# Altium project GTV3.5_Board.PrjPcb (part 3 of 12)
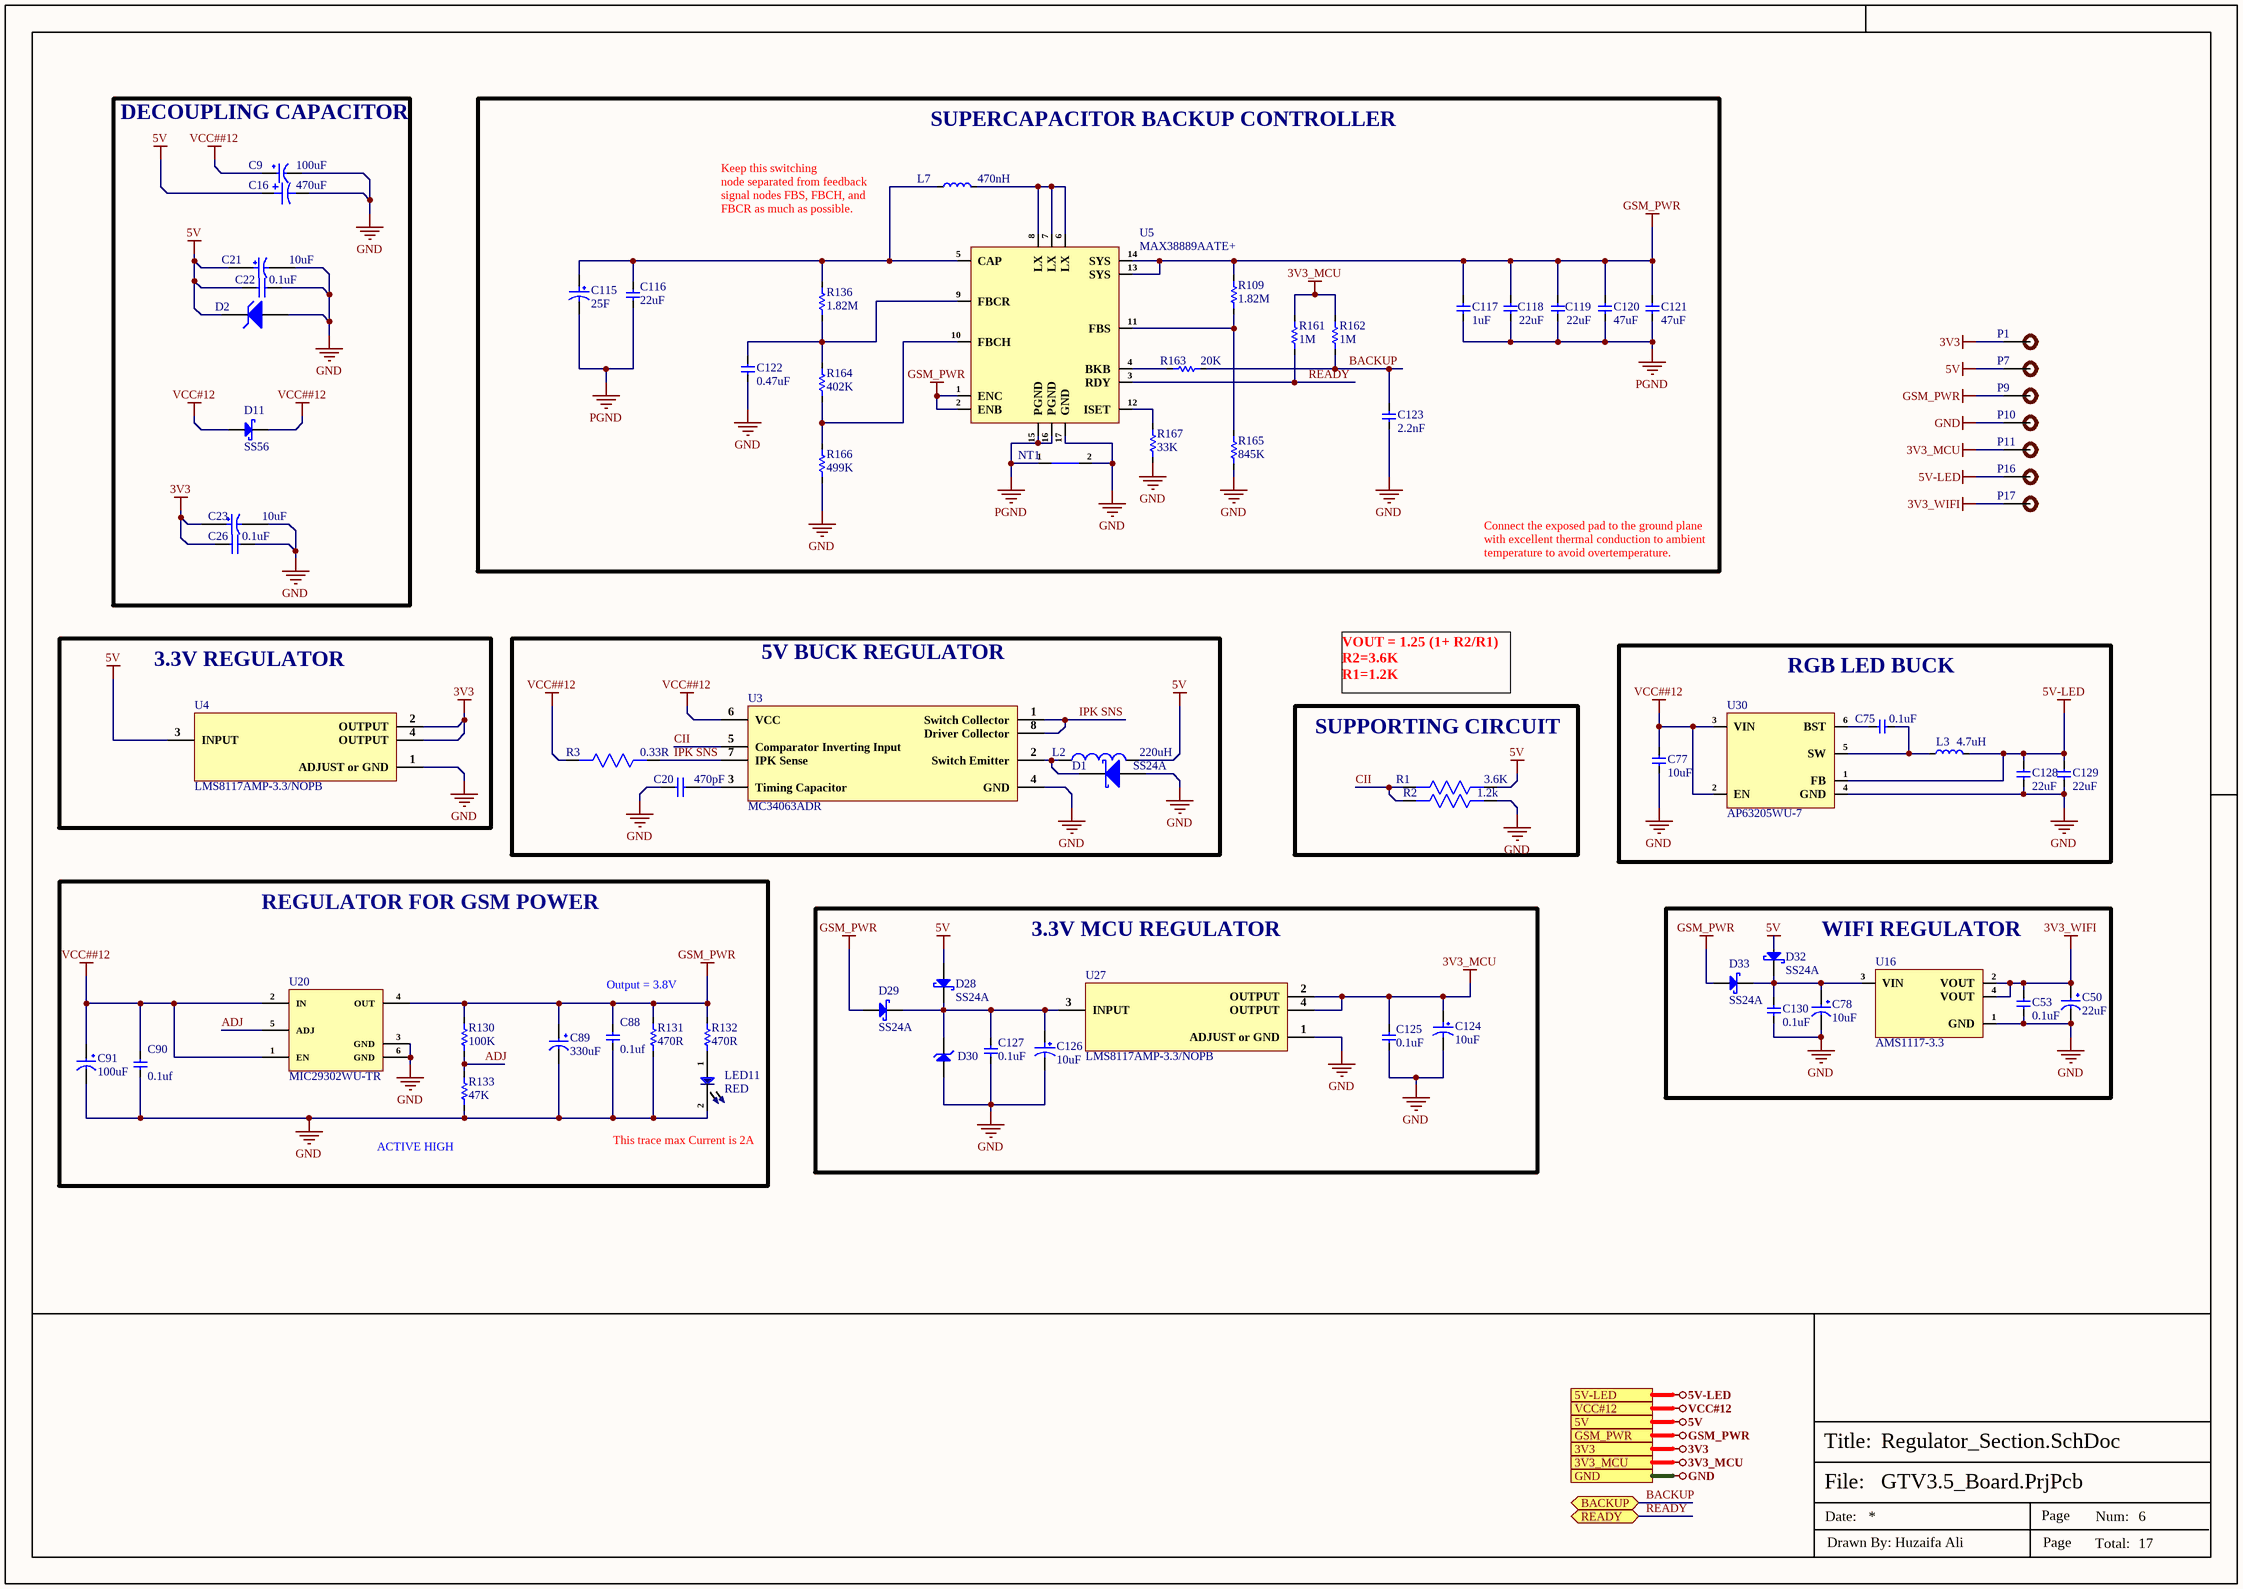
[diagram p109: Regulator_Section.SchDoc]

## Sheet Regulator_Section.SchDoc (continued)

### Library data of the parts (continued)
R130 = RC0201JR-07100KL: RES SMD 100K OHM 5% 1/20W 0201; Manufacturer: Yageo; Resistance: 100kR; Temperature Coefficient: 200ppm/°C; Power Rating: 50mW; Voltage Rating: 25V; Supplier 1: Arrow Electronics; Manufacturer Part Number: RC0201JR-07100KL; RoHS: Yes; Category: Chip SMD Resistors; Stock 1: 76; Pricing 1: 1=0.09240, 10=0.09140, 25=0.05450, 10000=0.00340, 100000=0.00320, 1000000=0.00180, 5000000=0.00110 (USD); Case/Package: 0201; Contact Plating: Tin,Matte; Case Code (Metric): 0603; Case Code (Imperial): 0201; Weight: 6E-06oz; Size Code: 0201; Min Operating Temperature: -55°C; Max Operating Temperature: 125°C; Tolerance: 5%; Resistor Type: Thick Film; Package Quantity: 1; Packaging: Tape and Reel; Number of Terminations: 2; Termination: SMD/SMT; Max Power Dissipation: 50mW; Voltage Rating (DC): 25V; Features: Moisture Resistant; Series: RC; Resistance Tolerance: 5%; Construction: Rectangular; Length: 0.6mm; Width: 0.012inch; Height: 0.01inch; Depth: 0.3mm; Radiation Hardening: No; REACH SVHC: No SVHC; Military Standard: Not; Lead Free: Lead Free; RoHS Compliant: Yes; ComponentLink1URL: https://datasheet.ciiva.com/2462/pyu-r-int-thick-7-2462817.pdf?src-supplier=Digi-Key; ComponentLink1Description: https://datasheet.ciiva.com/2462/pyu-r-int-thick-7-2462817.pdf?src-supplier=Digi-Key; ComponentLink2URL: https://datasheet.ciiva.com/2462/pyu-r-int-thick-7-2462818.pdf?src-supplier=Digi-Key; ComponentLink2Description: https://datasheet.ciiva.com/2462/pyu-r-int-thick-7-2462818.pdf?src-supplier=Digi-Key; ComponentLink3URL: https://datasheet.ciiva.com/2462/pyu-r-int-thick-7-2462819.pdf?src-supplier=Digi-Key; ComponentLink3Description: https://datasheet.ciiva.com/2462/pyu-r-int-thick-7-2462819.pdf?src-supplier=Digi-Key; ComponentLink4URL: https://datasheet.ciiva.com/8888/pyu-rc0201-51-rohs-l-8-8888005.pdf?src-supplier=Avnet; ComponentLink4Description: https://datasheet.ciiva.com/8888/pyu-rc0201-51-rohs-l-8-8888005.pdf?src-supplier=Avnet; ComponentLink5URL: https://datasheet.ciiva.com/8896/pyu-rc0201-51-rohs-l-8-8896213.pdf?src-supplier=Avnet; ComponentLink5Description: https://datasheet.ciiva.com/8896/pyu-rc0201-51-rohs-l-8-8896213.pdf?src-supplier=Avnet; ComponentLink6URL: https://datasheet.ciiva.com/28395/pyu-rc0201-51-rohs-l-8-28395542.pdf?src-supplier=Avnet+Europe; ComponentLink6Description: https://datasheet.ciiva.com/28395/pyu-rc0201-51-rohs-l-8-28395542.pdf?src-supplier=Avnet+Europe; ComponentLink7URL: https://datasheet.ciiva.com/28639/1421516-28639863.pdf?src-supplier=Element14; ComponentLink7Description: https://datasheet.ciiva.com/28639/1421516-28639863.pdf?src-supplier=Element14; ComponentLink8URL: https://datasheet.ciiva.com/7672/1563626-7672249.pdf?src-supplier=Element14; ComponentLink8Description: https://datasheet.ciiva.com/7672/1563626-7672249.pdf?src-supplier=Element14; ComponentLink9URL: https://datasheet.ciiva.com/7672/1563626-7672250.pdf?src-supplier=Element14; ComponentLink9Description: https://datasheet.ciiva.com/7672/1563626-7672250.pdf?src-supplier=Element14; Supplier Part Number 1: RC0201JR-07100KL; LCSC Part Number: C106230
R131 = RC0603FR-07470RL: RES 470 OHM 1% 1/10W 0603; Manufacturer: Yageo; Temperature Coefficient: 100ppm/°C; Max Power Dissipation: 100mW; Voltage Rating: 50V; Working Voltage: 75V; Supplier 1: Digi-Key; Manufacturer Part Number: RC0603FR-07470RL; RoHS: Yes; Category: Chip SMD Resistors; Stock 1: 154083; Pricing 1: 1=0.10000, 10=0.02400, 100=0.00970, 1000=0.00436, 2500=0.00378 (USD); Case/Package: 0603; Case Code (Metric): 1608; Case Code (Imperial): 0603; Min Operating Temperature: -55°C; Max Operating Temperature: 155°C; Resistor Type: Thick Film; Tolerance: 1%; Resistance: 470R; Number of Terminations: 2; Termination: SMD/SMT; Features: Moisture Resistant; Power Rating: 100mW; Package Quantity: 1; Packaging: Tape and Reel; Length: 1.6mm; Width: 0.031inch; Height: 0.022inch; Depth: 0.8mm; Military Standard: Not; Lead Free: Lead Free; REACH SVHC: No SVHC; ComponentLink1URL: https://datasheet.ciiva.com/11808/0900766b80f96399-11808177.pdf?src-supplier=RSComponents; ComponentLink1Description: https://datasheet.ciiva.com/11808/0900766b80f96399-11808177.pdf?src-supplier=RSComponents; ComponentLink2URL: https://datasheet.ciiva.com/7746/1738695-7746359.pdf?src-supplier=Element14; ComponentLink2Description: https://datasheet.ciiva.com/7746/1738695-7746359.pdf?src-supplier=Element14; ComponentLink3URL: https://datasheet.ciiva.com/7746/1738695-7746360.pdf?src-supplier=Element14; ComponentLink3Description: https://datasheet.ciiva.com/7746/1738695-7746360.pdf?src-supplier=Element14; ComponentLink4URL: https://datasheet.ciiva.com/7660/1868787-7660793.pdf?src-supplier=Element14; ComponentLink4Description: https://datasheet.ciiva.com/7660/1868787-7660793.pdf?src-supplier=Element14; ComponentLink5URL: https://datasheet.ciiva.com/46440/1868787-46440907.pdf?src-supplier=Element14; ComponentLink5Description: https://datasheet.ciiva.com/46440/1868787-46440907.pdf?src-supplier=Element14; ComponentLink6URL: https://datasheet.ciiva.com/2454/pyu-r-int-thick-7-2454012.pdf?src-supplier=Digi-Key; ComponentLink6Description: https://datasheet.ciiva.com/2454/pyu-r-int-thick-7-2454012.pdf?src-supplier=Digi-Key; ComponentLink7URL: https://datasheet.ciiva.com/2454/pyu-r-int-thick-7-2454013.pdf?src-supplier=Digi-Key; ComponentLink7Description: https://datasheet.ciiva.com/2454/pyu-r-int-thick-7-2454013.pdf?src-supplier=Digi-Key; Supplier Part Number 1: 311-470HRCT-ND; LCSC Part Number: C114669; Series: RC; Technology: THICK FILM; Resistance Tolerance: 1%; Construction: Rectangular; RoHS Compliant: Yes; ComponentLink8URL: https://datasheet.ciiva.com/2454/pyu-r-int-thick-7-2454014.pdf?src-supplier=Digi-Key; ComponentLink8Description: https://datasheet.ciiva.com/2454/pyu-r-int-thick-7-2454014.pdf?src-supplier=Digi-Key
R132 = RC0201JR-07470RL: RES 470 OHM 5% 1/20W 0201; Manufacturer: Yageo; Temperature Coefficient: 200ppm/°C; Voltage Rating (DC): 25V; Max Power Dissipation: 50mW; Supplier 1: Digi-Key; Manufacturer Part Number: RC0201JR-07470RL; RoHS: Yes; Category: Chip SMD Resistors; Stock 1: 173754; Pricing 1: 1=0.10000, 10=0.02600, 100=0.01040, 1000=0.00466, 2500=0.00405, 5000=0.00334 (USD); Case/Package: 0201; Number of Pins: 2; Contact Plating: Tin,Matte; Case Code (Metric): 0603; Case Code (Imperial): 0201; Min Operating Temperature: -55°C; Max Operating Temperature: 125°C; Resistor Type: Thick Film; Tolerance: 5%; Resistance: 470R; Number of Terminations: 2; Termination: SMD/SMT; Features: Moisture Resistant; Power Rating: 50mW; Voltage Rating: 25V; Package Quantity: 1; Packaging: Tape and Reel; Length: 0.6mm; Width: 0.3mm; Height: 0.01inch; Depth: 0.3mm; Radiation Hardening: No; Military Standard: Not; Lead Free: Lead Free; REACH SVHC: No SVHC; ComponentLink1URL: https://datasheet.ciiva.com/5924/443682-5924928.pdf?src-supplier=Farnell; ComponentLink1Description: https://datasheet.ciiva.com/5924/443682-5924928.pdf?src-supplier=Farnell; ComponentLink2URL: https://datasheet.ciiva.com/8885/pyu-rc0201-51-rohs-l-8-8885600.pdf?src-supplier=Avnet; ComponentLink2Description: https://datasheet.ciiva.com/8885/pyu-rc0201-51-rohs-l-8-8885600.pdf?src-supplier=Avnet; ComponentLink3URL: https://datasheet.ciiva.com/28390/pyu-rc0201-51-rohs-l-8-28390376.pdf?src-supplier=Avnet+Europe; ComponentLink3Description: https://datasheet.ciiva.com/28390/pyu-rc0201-51-rohs-l-8-28390376.pdf?src-supplier=Avnet+Europe; ComponentLink4URL: https://datasheet.ciiva.com/8885/pyu-rc0201-51-rohs-l-8-8885642.pdf?src-supplier=Avnet; ComponentLink4Description: https://datasheet.ciiva.com/8885/pyu-rc0201-51-rohs-l-8-8885642.pdf?src-supplier=Avnet; ComponentLink5URL: https://datasheet.ciiva.com/2462/pyu-r-int-thick-7-2462802.pdf?src-supplier=Digi-Key; ComponentLink5Description: https://datasheet.ciiva.com/2462/pyu-r-int-thick-7-2462802.pdf?src-supplier=Digi-Key; ComponentLink6URL: https://datasheet.ciiva.com/2462/pyu-r-int-thick-7-2462803.pdf?src-supplier=Digi-Key; ComponentLink6Description: https://datasheet.ciiva.com/2462/pyu-r-int-thick-7-2462803.pdf?src-supplier=Digi-Key; ComponentLink7URL: https://datasheet.ciiva.com/2462/pyu-r-int-thick-7-2462804.pdf?src-supplier=Digi-Key; ComponentLink7Description: https://datasheet.ciiva.com/2462/pyu-r-int-thick-7-2462804.pdf?src-supplier=Digi-Key; Supplier Part Number 1: 311-470NCT-ND; LCSC Part Number: C163491
R133 = RC0402FR-0747KL: RES 47K OHM 1% 1/16W 0402; Manufacturer: Yageo; Power Rating: 62.5mW; Temperature Coefficient: 100ppm/°C; Voltage Rating: 50V; Resistance: 47kR; Max Power Dissipation: 63mW; Item Type: Resistor; Supplier 1: Avnet; Manufacturer Part Number: RC0402FR-0747KL; RoHS: Yes; Category: Chip SMD Resistors; Stock 1: 680000; Pricing 1: 10000=0.00085, 20000=0.00087, 40000=0.00084, 60000=0.00083, 80000=0.00079, 100000=0.00078, 1000000=0.00076 (USD); Case/Package: 0402; Case Code (Imperial): 0402; Case Code (Metric): 1005; Size Code: 0402; Min Operating Temperature: -55°C; Max Operating Temperature: 155°C; Tolerance: 1%; Series: RC; Packaging: Tape and Reel; Package Quantity: 1; Termination: SMD/SMT; Resistor Type: Thick Film; Number of Terminations: 2; Features: Moisture Resistant; Resistance Tolerance: 1%; Construction: Rectangular; Length: 1mm; Width: 0.02inch; Height: 0.016inch; Depth: 0.5mm; RoHS Compliant: Yes; Military Standard: Not; Lead Free: Lead Free; ComponentLink1URL: https://datasheet.ciiva.com/46412/1018594-46412839.pdf?src-supplier=Element14; ComponentLink1Description: https://datasheet.ciiva.com/46412/1018594-46412839.pdf?src-supplier=Element14; ComponentLink2URL: https://datasheet.ciiva.com/2453/pyu-r-int-thick-7-2453389.pdf?src-supplier=Digi-Key; ComponentLink2Description: https://datasheet.ciiva.com/2453/pyu-r-int-thick-7-2453389.pdf?src-supplier=Digi-Key; ComponentLink3URL: https://datasheet.ciiva.com/2453/pyu-r-int-thick-7-2453390.pdf?src-supplier=Digi-Key; ComponentLink3Description: https://datasheet.ciiva.com/2453/pyu-r-int-thick-7-2453390.pdf?src-supplier=Digi-Key; ComponentLink4URL: https://datasheet.ciiva.com/2453/pyu-r-int-thick-7-2453388.pdf?src-supplier=Digi-Key; ComponentLink4Description: https://datasheet.ciiva.com/2453/pyu-r-int-thick-7-2453388.pdf?src-supplier=Digi-Key; ComponentLink5URL: https://datasheet.ciiva.com/15189/getdatasheetpartid-323748-15189466.pdf?src-supplier=Verical; ComponentLink5Description: https://datasheet.ciiva.com/15189/getdatasheetpartid-323748-15189466.pdf?src-supplier=Verical; ComponentLink6URL: https://datasheet.ciiva.com/16793/pyu-rc0402-51-rohs-l-6-r-16793430.pdf?src-supplier=Future+Electronics; ComponentLink6Description: https://datasheet.ciiva.com/16793/pyu-rc0402-51-rohs-l-6-r-16793430.pdf?src-supplier=Future+Electronics; Supplier Part Number 1: RC0402FR-0747KL; LCSC Part Number: C93943
R161 R162 = RC0603FR-071ML: RES SMD 1M OHM 1% 1/10W 0603; Manufacturer: Yageo; Voltage Rating: 50V; Resistance: 1MR; Power Rating: 100mW; Temperature Coefficient: 100ppm/°C; Item Type: Resistor; Supplier 1: Digi-Key; Manufacturer Part Number: RC0603FR-071ML; Stock 1: 3824601; Pricing 1: 1=0.1, 10=0.023, 100=0.0094, 1000=0.00421, 2500=0.00366 (USD); Case/Package: 0603; Number of Pins: 2; Case Code (Imperial): 0603; Case Code (Metric): 1608; Min Operating Temperature: -55°C; Max Operating Temperature: 155°C; Voltage Rating (DC): 50V; Tolerance: 1%; Packaging: Tape and Reel; Package Quantity: 5000; Termination: SMD/SMT; Composition: Thick Film; Military Standard: Not; Length: 1.6mm; Height: 0.45mm; Width: 0.8mm; Depth: 0.8mm; REACH SVHC: No SVHC; Lead Free: Lead Free; ComponentLink1URL: http://www.farnell.com/datasheets/2167052.pdf?src-supplier=Mouser; ComponentLink1Description: http://www.farnell.com/datasheets/2167052.pdf?src-supplier=Mouser; ComponentLink2URL: http://www.farnell.com/datasheets/2167052.pdf?src-supplier=Element14; ComponentLink2Description: http://www.farnell.com/datasheets/2167052.pdf?src-supplier=Element14; ComponentLink3URL: http://documents.rs-components.com/techlib://itc_doclist_GB.htm?stockno=5048956&src-supplier=RSComponents; ComponentLink3Description: http://documents.rs-components.com/techlib://itc_doclist_GB.htm?stockno=5048956&src-supplier=RSComponents; Supplier Part Number 1: 311-1.00MHRDKR-ND; LCSC Part Number: C105578
R163 = RC0603FR-0720KL: RES 20K OHM 1% 1/10W 0603; Manufacturer: Yageo; Resistance: 20kR; Temperature Coefficient: 100ppm/°C; Voltage Rating (DC): 50V; Power Rating: 100mW; Item Type: Resistor; Supplier 1: Arrow Electronics; Manufacturer Part Number: RC0603FR-0720KL; RoHS: Yes; Category: Chip SMD Resistors; Stock 1: 945000; Pricing 1: 5000=0.00240, 10000=0.00220, 25000=0.00200, 50000=0.00190, 125000=0.00180 (USD); Case/Package: 0603; Number of Pins: 2; Case Code (Imperial): 0603; Case Code (Metric): 1608; Size Code: 0603; Min Operating Temperature: -55°C; Max Operating Temperature: 155°C; Tolerance: 1%; Packaging: Tape and Reel; Resistor Type: Thick Film; Voltage Rating: 50V; Package Quantity: 1; Termination: SMD/SMT; Number of Terminations: 2; Max Power Dissipation: 100mW; Features: Moisture Resistant; Series: RC; Technology: THICK FILM; Construction: Rectangular; Resistance Tolerance: 1%; Length: 0.063inch; Width: 0.031inch; Height: 0.022inch; Depth: 0.8mm; Lead Free: Lead Free; RoHS Compliant: Yes; REACH SVHC: No SVHC; Military Standard: Not; ComponentLink1URL: https://datasheet.ciiva.com/11808/0900766b80f96399-11808275.pdf?src-supplier=RSComponents; ComponentLink1Description: https://datasheet.ciiva.com/11808/0900766b80f96399-11808275.pdf?src-supplier=RSComponents; ComponentLink2URL: https://datasheet.ciiva.com/22747/443971-22747525.pdf?src-supplier=Element14; ComponentLink2Description: https://datasheet.ciiva.com/22747/443971-22747525.pdf?src-supplier=Element14; ComponentLink3URL: https://datasheet.ciiva.com/2453/pyu-r-int-thick-7-2453911.pdf?src-supplier=Digi-Key; ComponentLink3Description: https://datasheet.ciiva.com/2453/pyu-r-int-thick-7-2453911.pdf?src-supplier=Digi-Key; ComponentLink4URL: https://datasheet.ciiva.com/2453/pyu-r-int-thick-7-2453912.pdf?src-supplier=Digi-Key; ComponentLink4Description: https://datasheet.ciiva.com/2453/pyu-r-int-thick-7-2453912.pdf?src-supplier=Digi-Key; ComponentLink5URL: https://datasheet.ciiva.com/2453/pyu-r-int-thick-7-2453910.pdf?src-supplier=Digi-Key; ComponentLink5Description: https://datasheet.ciiva.com/2453/pyu-r-int-thick-7-2453910.pdf?src-supplier=Digi-Key; Supplier Part Number 1: RC0603FR-0720KL; LCSC Part Number: C105575
R164 = CRCW0603402KFKEA: RES SMD 402K OHM 1% 1/10W 0603; Manufacturer: Vishay; Voltage Rating (DC): 75V; Item Type: Resistor; Supplier: Mouser; Supplier Part Number: 71-CRCW0603-402K-E3; Manufacturer Part Number: CRCW0603402KFKEA; RoHS: Yes; Category: Chip SMD Resistors; Stock: 15471; Pricing: 1=0.1, 10=0.019, 50=0.019, 100=0.009, 1000=0.007, 10000=0.004 (USD); Lead Free: 5697LeadFree; ComponentLink1URL: https://datasheet.ciiva.com/5541/dcrcwe3-109170-5541596.pdf?src-supplier=Mouser; ComponentLink1Description: https://datasheet.ciiva.com/5541/dcrcwe3-109170-5541596.pdf?src-supplier=Mouser; ComponentLink2URL: https://datasheet.ciiva.com/22705/1697337-22705964.pdf?src-supplier=Element14; ComponentLink2Description: https://datasheet.ciiva.com/22705/1697337-22705964.pdf?src-supplier=Element14; ComponentLink3URL: https://datasheet.ciiva.com/7792/125364-7792268.pdf?src-supplier=Element14; ComponentLink3Description: https://datasheet.ciiva.com/7792/125364-7792268.pdf?src-supplier=Element14; ComponentLink4URL: https://datasheet.ciiva.com/7674/1697337-7674093.pdf?src-supplier=Element14; ComponentLink4Description: https://datasheet.ciiva.com/7674/1697337-7674093.pdf?src-supplier=Element14; ComponentLink5URL: https://datasheet.ciiva.com/7674/1697337-7674094.pdf?src-supplier=Element14; ComponentLink5Description: https://datasheet.ciiva.com/7674/1697337-7674094.pdf?src-supplier=Element14; ComponentLink6URL: https://datasheet.ciiva.com/3257/dcrcwe3-3257561.pdf?src-supplier=Avnet; ComponentLink6Description: https://datasheet.ciiva.com/3257/dcrcwe3-3257561.pdf?src-supplier=Avnet; ComponentLink7URL: https://datasheet.ciiva.com/2466/dcrcwe3-2466643.pdf?src-supplier=Digikey; ComponentLink7Description: https://datasheet.ciiva.com/2466/dcrcwe3-2466643.pdf?src-supplier=Digikey; ComponentLink8URL: https://datasheet.ciiva.com/2466/dcrcwe3-2466641.pdf?src-supplier=Digikey; ComponentLink8Description: https://datasheet.ciiva.com/2466/dcrcwe3-2466641.pdf?src-supplier=Digikey; ComponentLink9URL: https://datasheet.ciiva.com/2466/dcrcwe3-2466642.pdf?src-supplier=Digikey; ComponentLink9Description: https://datasheet.ciiva.com/2466/dcrcwe3-2466642.pdf?src-supplier=Digikey; ComponentLink10URL: https://datasheet.ciiva.com/16769/70201119-16769689.pdf?src-supplier=Allied+Electronics; ComponentLink10Description: https://datasheet.ciiva.com/16769/70201119-16769689.pdf?src-supplier=Allied+Electronics; ComponentLink11URL: https://datasheet.ciiva.com/16427/dcrcwe3-16427337.pdf?src-supplier=Future+Electronics; ComponentLink11Description: https://datasheet.ciiva.com/16427/dcrcwe3-16427337.pdf?src-supplier=Future+Electronics
R165 = RC0603FR-07845KL: RES 845K OHM 1% 1/10W 0603; Manufacturer: Yageo; Item Type: Resistor; Supplier: Future Electronics; Supplier Part Number: 2538940; Manufacturer Part Number: RC0603FR-07845KL; RoHS: Yes; Category: Chip SMD Resistors; Stock: 90000; Pricing: 5000=0.0026, 50000=0.0025, 150000=0.0024, 375000=0.0023, 1000000=0.0021 (USD); ComponentLink1URL: https://datasheet.ciiva.com/8884/pyu-rc0603-51-rohs-l-4-8884697.pdf?src-supplier=Avnet; ComponentLink1Description: https://datasheet.ciiva.com/8884/pyu-rc0603-51-rohs-l-4-8884697.pdf?src-supplier=Avnet; ComponentLink2URL: https://datasheet.ciiva.com/2455/pyu-r-int-thick-7-2455278.pdf?src-supplier=Digikey; ComponentLink2Description: https://datasheet.ciiva.com/2455/pyu-r-int-thick-7-2455278.pdf?src-supplier=Digikey; ComponentLink3URL: https://datasheet.ciiva.com/2455/pyu-r-int-thick-7-2455279.pdf?src-supplier=Digikey; ComponentLink3Description: https://datasheet.ciiva.com/2455/pyu-r-int-thick-7-2455279.pdf?src-supplier=Digikey; ComponentLink4URL: https://datasheet.ciiva.com/2455/pyu-r-int-thick-7-2455280.pdf?src-supplier=Digikey; ComponentLink4Description: https://datasheet.ciiva.com/2455/pyu-r-int-thick-7-2455280.pdf?src-supplier=Digikey
R166 = RC0603FR-07499KL: RES 499K OHM 1% 1/10W 0603; Manufacturer: Yageo; Voltage Rating (DC): 50V; Item Type: Resistor; Supplier: Future Electronics; Supplier Part Number: 1580604; Manufacturer Part Number: RC0603FR-07499KL; RoHS: Yes; Category: Chip SMD Resistors; Stock: 750000; Pricing: 5000=0.0015, 50000=0.0014, 200000=0.0014, 625000=0.0013, 2000000=0.0012 (USD); Lead Free: 5697LeadFree; ComponentLink1URL: https://datasheet.ciiva.com/15189/getdatasheetpartid-329306-15189746.pdf?src-supplier=Verical; ComponentLink1Description: https://datasheet.ciiva.com/15189/getdatasheetpartid-329306-15189746.pdf?src-supplier=Verical; ComponentLink2URL: https://datasheet.ciiva.com/11819/0900766b80f96399-11819364.pdf?src-supplier=Rs; ComponentLink2Description: https://datasheet.ciiva.com/11819/0900766b80f96399-11819364.pdf?src-supplier=Rs; ComponentLink3URL: https://datasheet.ciiva.com/2454/pyu-r-int-thick-7-2454186.pdf?src-supplier=Digi-Key; ComponentLink3Description: https://datasheet.ciiva.com/2454/pyu-r-int-thick-7-2454186.pdf?src-supplier=Digi-Key; ComponentLink4URL: https://datasheet.ciiva.com/2454/pyu-r-int-thick-7-2454187.pdf?src-supplier=Digi-Key; ComponentLink4Description: https://datasheet.ciiva.com/2454/pyu-r-int-thick-7-2454187.pdf?src-supplier=Digi-Key; ComponentLink5URL: https://datasheet.ciiva.com/2454/pyu-r-int-thick-7-2454188.pdf?src-supplier=Digi-Key; ComponentLink5Description: https://datasheet.ciiva.com/2454/pyu-r-int-thick-7-2454188.pdf?src-supplier=Digi-Key; LCSC Part Number: C131054
R167 = CRCW060333K0JNEA: RES SMD 33K OHM 5% 1/10W 0603; Item Type: Resistor; Value: 33kR; Power Rating: 100mW; Voltage Rating: 75V; Temperature Coefficient: 200ppm/°C; LCSC Part Number: C4342762; ComponentLink1Description: LCSC; Supplier: Mouser; Supplier Part Number: 71-CRCW0603J-33K-E3; RoHS: Yes; Category: Chip SMD Resistors; Stock: 42690; Pricing: 1=0.1, 10=0.017, 50=0.017, 100=0.008, 1000=0.006, 10000=0.003 (USD); Case/Package: 0603; Pins: 2; Case Code (Metric): 1608; Case Code (Imperial): 0603; Weight: 7.1E-05oz; Contact Plating: Tin; Min Operating Temperature: -55°C; Max Operating Temperature: 155°C; Tolerance: 5%; Packaging: Tape and Reel; Package Quantity: 5000; Resistor Type: Thick Film; Number of Terminations: 2; Termination: SMD/SMT; Max Power Dissipation: 100mW; Voltage Rating (DC): 75V; Features: Automotive AEC-Q200; Series: CRCW; Resistance Tolerance: 5%; Construction: Rectangular; Technology: THICK FILM; Length: 1.55mm; Width: 0.85mm; Height: 0.45mm; Depth: 0.85mm; Ratings: AEC-Q200; Radiation Hardening: No; Lead Free: Lead Free; RoHS Compliant: Yes; Reach SVHC Compliant: Unknown; Military Standard: Not; ComponentLink2URL: https://datasheet.ciiva.com/2462/dcrcwe3-2462530.pdf?src-supplier=Digi-Key; ComponentLink2Description: https://datasheet.ciiva.com/2462/dcrcwe3-2462530.pdf?src-supplier=Digi-Key; ComponentLink3URL: https://datasheet.ciiva.com/2462/dcrcwe3-2462531.pdf?src-supplier=Digi-Key; ComponentLink3Description: https://datasheet.ciiva.com/2462/dcrcwe3-2462531.pdf?src-supplier=Digi-Key; ComponentLink4URL: https://datasheet.ciiva.com/2462/dcrcwe3-2462529.pdf?src-supplier=Digi-Key; ComponentLink4Description: https://datasheet.ciiva.com/2462/dcrcwe3-2462529.pdf?src-supplier=Digi-Key; ComponentLink5URL: https://datasheet.ciiva.com/16778/70201119-16778952.pdf?src-supplier=Allied+Electronics; ComponentLink5Description: https://datasheet.ciiva.com/16778/70201119-16778952.pdf?src-supplier=Allied+Electronics; ComponentLink6URL: https://datasheet.ciiva.com/5551/dcrcwe3-109170-5551035.pdf?src-supplier=Mouser; ComponentLink6Description: https://datasheet.ciiva.com/5551/dcrcwe3-109170-5551035.pdf?src-supplier=Mouser; ComponentLink7URL: https://datasheet.ciiva.com/3257/dcrcwe3-3257470.pdf?src-supplier=Avnet; ComponentLink7Description: https://datasheet.ciiva.com/3257/dcrcwe3-3257470.pdf?src-supplier=Avnet; ComponentLink8URL: https://datasheet.ciiva.com/16389/dcrcwe3-16389979.pdf?src-supplier=Future+Electronics; ComponentLink8Description: https://datasheet.ciiva.com/16389/dcrcwe3-16389979.pdf?src-supplier=Future+Electronics; ComponentLink9URL: https://datasheet.ciiva.com/3257/dcrcwe3-3257469.pdf?src-supplier=Avnet; ComponentLink9Description: https://datasheet.ciiva.com/3257/dcrcwe3-3257469.pdf?src-supplier=Avnet
U3 = MC34063ADR: 1.5-A boost, buck, inverting switching regulator, operation from 0°C to 70°C 8-SOIC 0 to 70; Manufacturer: Texas Instruments; Output Voltage: 40V; Number of Outputs: 1; Output Current: 1.5A; Switching Frequency: 100kHz; Synchronous Rectifier: No; Output Type: Adjustable; Max Output Current: 750mA; Min Input Voltage: 3V; Min Output Voltage: 1.55V; Quiescent Current: 4mA; Topology: Flyback,SEPIC; Supplier 1: Digi-Key; Manufacturer Part Number: MC34063ADR; RoHS: Yes; Category: Power Supply Modules; Stock 1: 17204; Pricing 1: 1=0.78000, 10=0.68400, 25=0.64240, 100=0.52420, 250=0.48688, 500=0.41438, 1000=0.34206 (USD); Case/Package: D; Number of Pins: 8; Weight: 0.002561oz; Contact Plating: Gold; Min Operating Temperature: 0°C; Max Operating Temperature: 70°C; Packaging: Tape and Reel; Package Quantity: 1; Max Input Voltage: 40V; Max Output Voltage: 40V; Termination: SMD/SMT; Radiation Hardening: No; RoHS Compliant: Yes; Lead Free: Lead Free; REACH SVHC: No SVHC; ComponentLink1URL: https://datasheet.ciiva.com/7408/1862376-7408060.pdf?src-supplier=Newark; ComponentLink1Description: https://datasheet.ciiva.com/7408/1862376-7408060.pdf?src-supplier=Newark; ComponentLink2URL: https://datasheet.ciiva.com/2025/mc33063a-2025162.pdf?src-supplier=Digi-Key; ComponentLink2Description: https://datasheet.ciiva.com/2025/mc33063a-2025162.pdf?src-supplier=Digi-Key; ComponentLink3URL: https://datasheet.ciiva.com/2025/mc33063a-2025161.pdf?src-supplier=Digi-Key; ComponentLink3Description: https://datasheet.ciiva.com/2025/mc33063a-2025161.pdf?src-supplier=Digi-Key; ComponentLink4URL: https://datasheet.ciiva.com/2025/mc33063a-2025163.pdf?src-supplier=Digi-Key; ComponentLink4Description: https://datasheet.ciiva.com/2025/mc33063a-2025163.pdf?src-supplier=Digi-Key; Supplier Part Number 1: 296-17765-1-ND
U4 U27 = LMS8117AMP-3.3/NOPB: IC REG LINEAR 3.3V 1A SOT223; Manufacturer: Texas Instruments; Number of Outputs: 1; Min Input Voltage: 2.5V; Max Input Voltage: 15V; Polarity: Positive; Quiescent Current: 10mA; Accuracy: 1%; Output Type: Fixed; Dropout Voltage: 1.2V; Nominal Supply Current: 5mA; Supplier 1: Arrow Electronics; Manufacturer Part Number: LMS8117AMP-3.3/NOPB; RoHS: Yes; Category: Voltage Regulators - Linear; Stock 1: 843; Pricing 1: 1=1.18760, 10=1.01800, 100=0.77540, 250=0.68460, 500=0.64870, 1000=0.59270 (USD); Mount: Surface Mount; Case/Package: SOT-223; Number of Pins: 4; Contact Plating: Tin,Matte; Min Operating Temperature: 0°C; Max Operating Temperature: 125°C; Output Voltage: 3.3V; Max Output Current: 1A; Packaging: Tape and Reel; Output Current: 1A; Nominal Output Voltage: 3.3V; Output Voltage Accuracy: 1%; Current Rating: 1A; Package Quantity: 1000; Length: 6.5mm; Width: 3.56mm; Height: 1.6mm; Radiation Hardening: No; REACH SVHC: No SVHC; Lead Free: Lead Free; RoHS Compliant: Yes; Supplier Part Number 1: LMS8117AMP-3.3/NOPB
  U4: ComponentLink1URL: https://datasheet.ciiva.com/3225/lms8117a-3225472.pdf?src-supplier=Avnet; ComponentLink1Description: https://datasheet.ciiva.com/3225/lms8117a-3225472.pdf?src-supplier=Avnet; ComponentLink2URL: https://datasheet.ciiva.com/2066/lms8117a-2066594.pdf?src-supplier=Digi-Key; ComponentLink2Description: https://datasheet.ciiva.com/2066/lms8117a-2066594.pdf?src-supplier=Digi-Key; ComponentLink3URL: https://datasheet.ciiva.com/2066/lms8117a-2066595.pdf?src-supplier=Digi-Key; ComponentLink3Description: https://datasheet.ciiva.com/2066/lms8117a-2066595.pdf?src-supplier=Digi-Key; ComponentLink4URL: https://datasheet.ciiva.com/2066/lms8117a-2066596.pdf?src-supplier=Digi-Key; ComponentLink4Description: https://datasheet.ciiva.com/2066/lms8117a-2066596.pdf?src-supplier=Digi-Key; ComponentLink5URL: https://datasheet.ciiva.com/3223/lms8117a-3223813.pdf?src-supplier=Avnet; ComponentLink5Description: https://datasheet.ciiva.com/3223/lms8117a-3223813.pdf?src-supplier=Avnet; ComponentLink6URL: https://datasheet.ciiva.com/25979/lms8117a-25979141.pdf?src-supplier=Avnet+Europe; ComponentLink6Description: https://datasheet.ciiva.com/25979/lms8117a-25979141.pdf?src-supplier=Avnet+Europe; ComponentLink7URL: https://datasheet.ciiva.com/46386/1558097-46386039.pdf?src-supplier=Element14; ComponentLink7Description: https://datasheet.ciiva.com/46386/1558097-46386039.pdf?src-supplier=Element14; ComponentLink8URL: https://datasheet.ciiva.com/8042/90386-8042363.pdf?src-supplier=Element14; ComponentLink8Description: https://datasheet.ciiva.com/8042/90386-8042363.pdf?src-supplier=Element14; ComponentLink9URL: https://datasheet.ciiva.com/5697/1558097-5697692.pdf?src-supplier=Farnell; ComponentLink9Description: https://datasheet.ciiva.com/5697/1558097-5697692.pdf?src-supplier=Farnell
  U27: LCSC Part Number: C201952; Item Type: IC; ComponentLink11Description: LCSC; ComponentLink11URL: https://www.lcsc.com/product-detail/Linear-Voltage-Regulators-LDO_Texas-Instruments-LMS8117AMP-3-3-NOPB_C201952.html
U5 = MAX38889AATE+: IC REG BUCK-BOOST ADJ 3A 16TQFN; Manufacturer: Analog Devices; Supplier: Mouser; Supplier Part Number: 700-MAX38889AATE+; Manufacturer Part Number: MAX38889AATE+; RoHS: No; Category: Voltage Regulators - Switching; Stock: 2896; Pricing: 1=6.25, 10=5.65, 50=4.68, 100=4.47, 1000=3.7, 10000=3.7 (USD); Item Type: IC
U16 = AMS1117-3.3: SOT-223 Linear Voltage Regulators (LDO) ROHS; Manufacturer: GUOXIN JIAPIN SEMICONDUCTOR; Item Type: IC; Manufacturer Part Number: AMS1117-3.3; Package: SOT-223; LCSC Part Number: C2992570; ComponentLink1Description: LCSC; ComponentLink1URL: https://www.lcsc.com/product-detail/Linear-Voltage-Regulators-LDO_GUOXIN-JIAPIN-SEMICONDUCTOR-AMS1117-3-3_C2992570.html
U20 = MIC29302WU-TR: IC REG LDO ADJ 3A TO263-5; Manufacturer: Microchip; Output Voltage: 26V; Dropout Voltage: 370mV; Number of Regulators: 1; Min Input Voltage: 2.5V; Min Output Voltage: 1.25V; Max Output Voltage: 25V; Output Type: Adjustable; Output Configuration: Positive; Input Bias Current: 40nA; Reference Voltage: 1.24V; Quiescent Current: 35mA; Accuracy: 1%; Supplier 1: Future Electronics; Manufacturer Part Number: MIC29302WU-TR; RoHS: Yes; Category: Voltage Regulators - Linear; Pricing 1: 750=2.12000, 1500=2.09000, 2250=2.07000, 3000=2.06000, 3750=2.02000 (USD); Mount: Surface Mount; Case/Package: TO-263; Number of Pins: 5; Min Operating Temperature: -40°C; Max Operating Temperature: 125°C; Packaging: Tape and Reel; Package Quantity: 750; Series: -; Output Current: 3A; Max Input Voltage: 26V; Polarity: Positive; Number of Outputs: 1; Max Output Current: 3A; Length: 10.67mm; Width: 9.17mm; Height: 4.59mm; Radiation Hardening: No; Reach SVHC Compliant: Yes; RoHS Compliant: Yes; Lead Free: Lead Free; ComponentLink1URL: https://datasheet.ciiva.com/23772/1572633-23772885.pdf?src-supplier=Newark; ComponentLink1Description: https://datasheet.ciiva.com/23772/1572633-23772885.pdf?src-supplier=Newark; ComponentLink2URL: https://datasheet.ciiva.com/16296/mic29150-16296190.pdf?src-supplier=Future+Electronics; ComponentLink2Description: https://datasheet.ciiva.com/16296/mic29150-16296190.pdf?src-supplier=Future+Electronics; ComponentLink3URL: https://datasheet.ciiva.com/15200/getdatasheetpartid-143209-15200663.pdf?src-supplier=Verical; ComponentLink3Description: https://datasheet.ciiva.com/15200/getdatasheetpartid-143209-15200663.pdf?src-supplier=Verical; Supplier Part Number 1: 3153683; LCSC Part Number: C11149; Item Type: IC
U30 = AP63205WU-7: IC REG BUCK 5V 2A TSOT26; Manufacturer: Diodes; Supplier 1: Digi-Key; Manufacturer Part Number: AP63205WU-7; RoHS: Yes; Category: Voltage Regulators - Switching; Stock 1: 88525; Pricing 1: 1=0.88, 10=0.776, 25=0.7292, 100=0.5952, 250=0.55284, 500=0.4705, 1000=0.3764 (USD); Supplier Part Number 1: AP63205WU-7DICT-ND; LCSC Part Number: C2071056; Item Type: IC

## Sheet Reverse Protection_Section.SchDoc
size 420 x 297 mm; DocumentNumber: 3; SheetNumber: 3; SheetTotal: 17
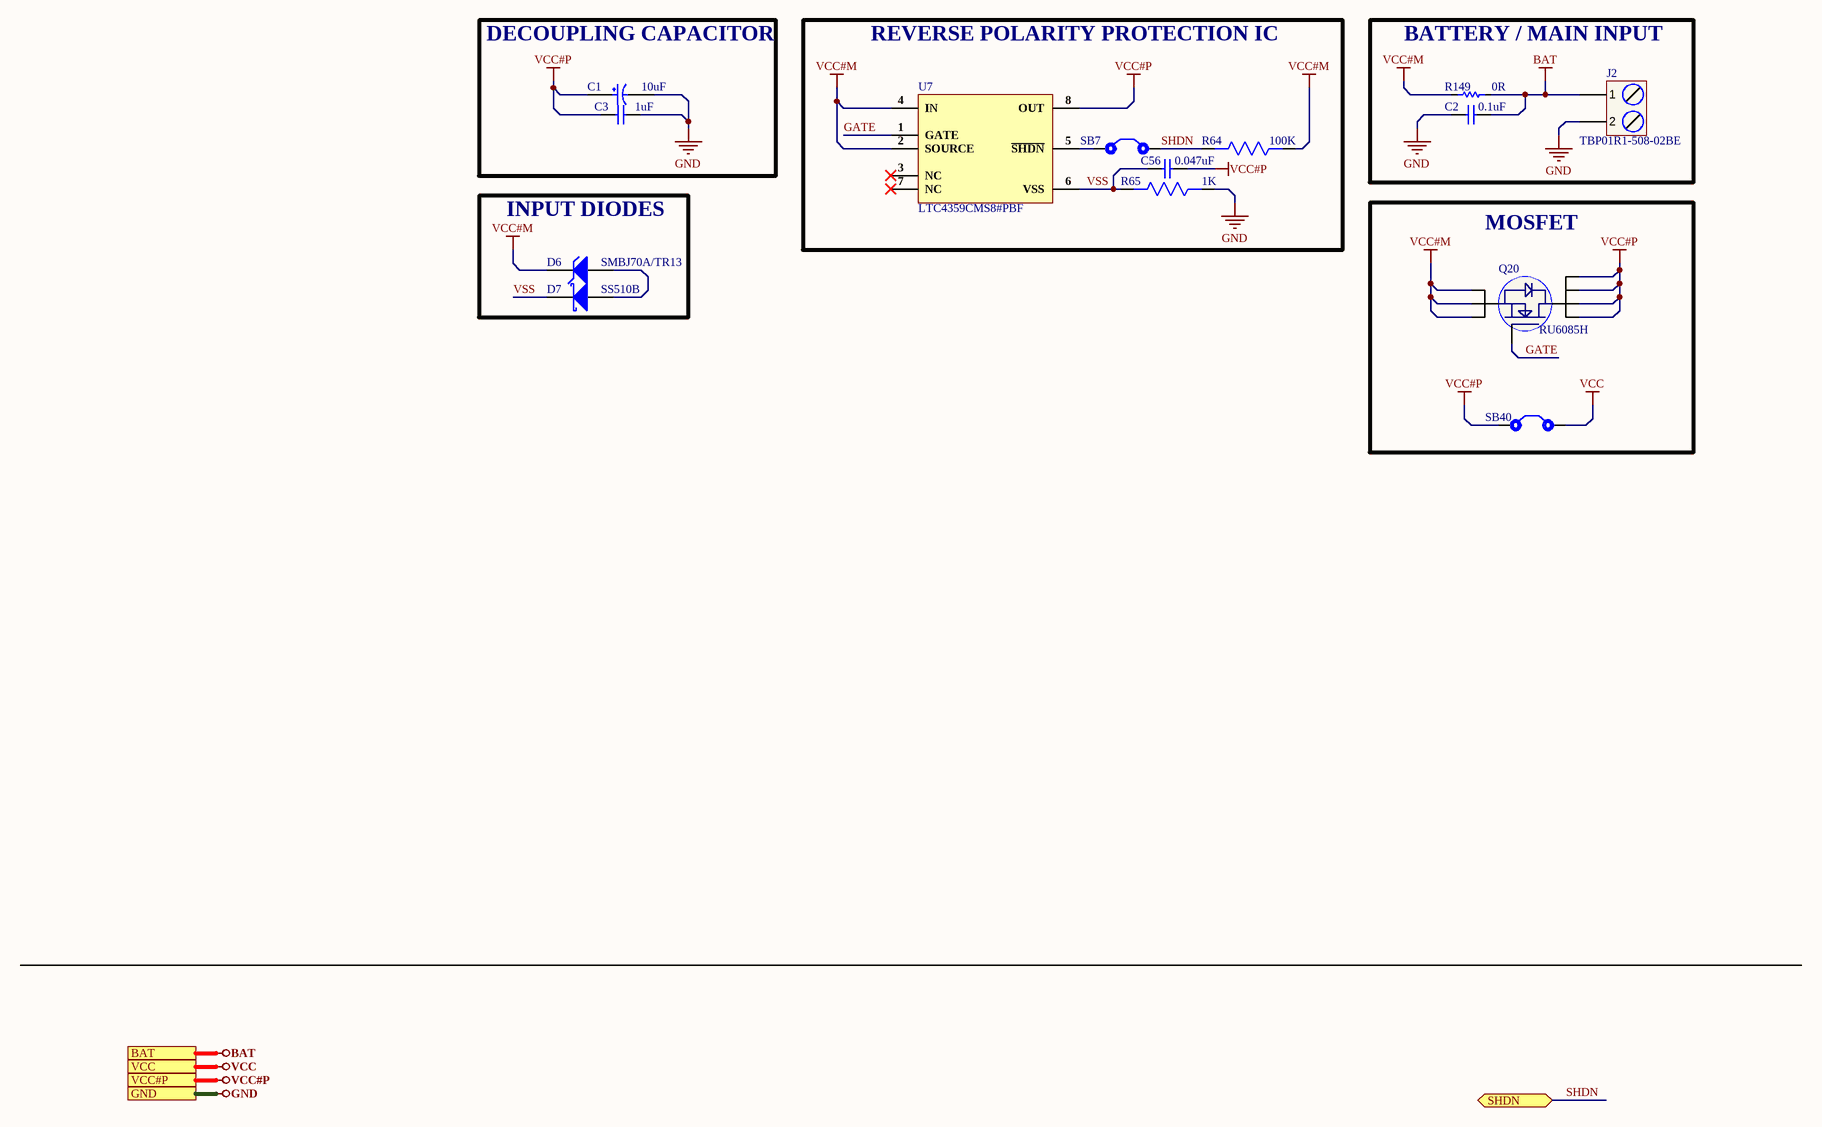
[diagram p5: Reverse Protection_Section.SchDoc]

### Parts
C1  10uF  [RVT1E100M0405.]
C2  0.1uF  [Cap-1206]
C3  1uF  [Cap0603]
C56  0.047uF  [Cap-1206]
D6  SMBJ70A/TR13  [SMB]
D7  SS510B  [SS510B]
J2  TBP01R1-508-02BE  [TBP01R1-508-02BE]
Q20  RU6085H  [RU6085H]
R64  100K  [RES-0805]
R65  1K  [Res-1206]
R149  0R  [RES-2512]
SB7  Solder Bridge  [Solder Bridge]  (value not drawn)
SB40  Solder Bridge  [Solder Bridge]  (value not drawn)
U7  LTC4359CMS8#PBF  [LTC4359CMS8#PBF]

### Blocks framed on the sheet
DECOUPLING CAPACITOR: C1 C3
REVERSE POLARITY PROTECTION IC: C56 R64 R65 SB7 U7
BATTERY / MAIN INPUT: C2 J2 R149
INPUT DIODES: D6 D7
MOSFET: Q20 SB40

### Ports
BAT, GND, SHDN (bidir), VCC, VCC#P

### Nets
BAT: C2.2 J2.1 R149.2 ; port BAT
GND: C1.2 C2.1 C3.2 J2.2 R65.1 ; port GND
VCC: SB40.2 ; port VCC
VCC#M: D6.1(K) Q20.1(S) Q20.2(S) Q20.3(S) R64.1 R149.1 U7.2(SOURCE) U7.4(IN)
VCC#P: C1.1 C3.1 C56.2 Q20.5(D) Q20.6(D) Q20.7(D) Q20.8(D) SB40.1 U7.8(OUT) ; port VCC#P
GATE: Q20.4(G) U7.1(GATE)
SHDN: R64.2 SB7.2 ; port SHDN
VSS: C56.1 D7.1(K) R65.2 U7.6(VSS)
NetD6_2: D6.2(A) D7.2(A)
NetSB7_1: SB7.1 U7.5(~{SHDN})

Not connected (* = marked no-connect by the designer): U7 3(NC)* 7(NC)*

### Notes on the sheet
- File:
- Title:
- Date:
- Page
- Num:
- Total:
- Drawn By: Huzaifa Ali

### Library data of the parts
C1 = RVT1E100M0405: as C4 on sheet Current_Sense_Section; Operating Temperature: -45℃~+105℃; Rated Voltage: 25V; Capacitance: 10uF
C2 = CC1206KKX7R0BB104: CAP CER 0.1UF 100V X7R 1206; Manufacturer: Yageo; Dielectric Material: Ceramic; Tolerance: 10%; Voltage: 63V; Capacitance: 100nF; Item Type: Capacitor; Supplier 1: Avnet; Manufacturer Part Number: CC1206KKX7R0BB104; RoHS: Yes; Category: Ceramic Capacitors; Stock 1: 24000; Pricing 1: 3000=0.01588, 6000=0.01565, 12000=0.01520, 18000=0.01486, 24000=0.01429, 30000=0.01395, 300000=0.01361 (USD); Mount: Surface Mount; Case/Package: 1206; Number of Pins: 2; Case Code (Metric): 3216; Case Code (Imperial): 1206; Min Operating Temperature: -55°C; Max Operating Temperature: 125°C; Dielectric: X7R; Package Quantity: 1; Voltage Rating: 100V; Packaging: Tape and Reel; Voltage Rating (DC): 100V; Termination: SMD/SMT; Resistor Type: Ceramic; Series: CC; Length: 3.2mm; Width: 0.063inch; Height: 1.25mm; Thickness: 0.057inch; Depth: 1.6mm; Radiation Hardening: No; RoHS Compliant: Yes; Reach SVHC Compliant: Yes; Lead Free: Lead Free; ComponentLink1URL: https://datasheet.ciiva.com/7978/1447671-7978227.pdf?src-supplier=Element14; ComponentLink1Description: https://datasheet.ciiva.com/7978/1447671-7978227.pdf?src-supplier=Element14; ComponentLink2URL: https://datasheet.ciiva.com/46391/1919308-46391993.pdf?src-supplier=Element14; ComponentLink2Description: https://datasheet.ciiva.com/46391/1919308-46391993.pdf?src-supplier=Element14; ComponentLink3URL: https://datasheet.ciiva.com/180/mlccorderingcode-180145.pdf?src-supplier=Digi-Key; ComponentLink3Description: https://datasheet.ciiva.com/180/mlccorderingcode-180145.pdf?src-supplier=Digi-Key; ComponentLink4URL: https://datasheet.ciiva.com/180/mlccorderingcode-180144.pdf?src-supplier=Digi-Key; ComponentLink4Description: https://datasheet.ciiva.com/180/mlccorderingcode-180144.pdf?src-supplier=Digi-Key; ComponentLink5URL: https://datasheet.ciiva.com/180/mlccorderingcode-180146.pdf?src-supplier=Digi-Key; ComponentLink5Description: https://datasheet.ciiva.com/180/mlccorderingcode-180146.pdf?src-supplier=Digi-Key; ComponentLink6URL: https://datasheet.ciiva.com/5425/upy-gp-np0-16v-to-50v-8-5425573.pdf?src-supplier=Mouser; ComponentLink6Description: https://datasheet.ciiva.com/5425/upy-gp-np0-16v-to-50v-8-5425573.pdf?src-supplier=Mouser; ComponentLink7URL: https://datasheet.ciiva.com/16981/upy-np0x7r-mv-100-to-630v-9-16981180.pdf?src-supplier=Future+Electronics; ComponentLink7Description: https://datasheet.ciiva.com/16981/upy-np0x7r-mv-100-to-630v-9-16981180.pdf?src-supplier=Future+Electronics; ComponentLink8URL: https://datasheet.ciiva.com/26829/getdatasheetpartid-403790-26829655.pdf?src-supplier=Verical; ComponentLink8Description: https://datasheet.ciiva.com/26829/getdatasheetpartid-403790-26829655.pdf?src-supplier=Verical; Supplier Part Number 1: CC1206KKX7R0BB104; LCSC Part Number: C107181
C3 = CC0603KRX5R8BB105: CAP CER 1UF 25V X5R 0603; Manufacturer: Yageo; Tolerance: 10%; Supplier 1: Digi-Key; Manufacturer Part Number: CC0603KRX5R8BB105; Stock 1: 1419041; Pricing 1: 1=0.1, 10=0.069, 100=0.0307, 500=0.0219, 1000=0.0172 (USD); Mount: Surface Mount; Case/Package: 0603; Number of Pins: 2; Case Code (Metric): 1608; Case Code (Imperial): 0603; Min Operating Temperature: -55°C; Max Operating Temperature: 85°C; Capacitance: 1uF; Dielectric: X5R; Package Quantity: 1; Voltage Rating: 25V; Packaging: Tape and Reel; Termination: SMD/SMT; Voltage Rating (DC): 25V; Length: 1.6mm; Height: 0.8mm; Width: 0.031inch; Thickness: 0.035inch; Depth: 0.8mm; Radiation Hardening: No; REACH SVHC: No SVHC; Lead Free: Lead Free; Halogen Free: Halogen Free; ComponentLink1URL: http://www.yageo.com/documents/recent/UPY-GPHC_X5R_4V-to-50V_25.pdf?src-supplier=Digi-Key; ComponentLink1Description: http://www.yageo.com/documents/recent/UPY-GPHC_X5R_4V-to-50V_25.pdf?src-supplier=Digi-Key; ComponentLink2URL: http://www.yageo.com/documents/recent/UPY-GPHC_X5R_4V-to-50V_12.pdf?src-supplier=Avnet+Europe; ComponentLink2Description: http://www.yageo.com/documents/recent/UPY-GPHC_X5R_4V-to-50V_12.pdf?src-supplier=Avnet+Europe; ComponentLink3URL: http://www.farnell.com/datasheets/1525783.pdf?src-supplier=Element14; ComponentLink3Description: http://www.farnell.com/datasheets/1525783.pdf?src-supplier=Element14; ComponentLink4URL: http://www.yageo.com/documents/recent/UPY-GPHC_X5R_4V-to-50V_12.pdf?src-supplier=Avnet; ComponentLink4Description: http://www.yageo.com/documents/recent/UPY-GPHC_X5R_4V-to-50V_12.pdf?src-supplier=Avnet; Supplier Part Number 1: 311-1445-6-ND
C56 = CC1206JRX7R0BB473: CAP CER 0.047UF 100V X7R 1206; Manufacturer: Yageo; Tolerance: 5%; Capacitance: 47nF; Item Type: Capacitor; Supplier 1: Arrow Electronics; Manufacturer Part Number: CC1206JRX7R0BB473; RoHS: Yes; Category: Ceramic Capacitors; Stock 1: 6600; Pricing 1: 1=0.21620, 10=0.10530, 25=0.10420, 100=0.08480, 250=0.08390, 500=0.05860, 1000=0.05090, 3000=0.04900, 6000=0.02930 (USD); Mount: Surface Mount; Case/Package: 1206; Case Code (Imperial): 1206; Case Code (Metric): 3216; Min Operating Temperature: -55°C; Max Operating Temperature: 125°C; Packaging: Tape and Reel; Voltage Rating (DC): 100V; Dielectric: X7R; Termination: SMD/SMT; Resistor Type: Ceramic; Voltage Rating: 100V; Series: CC; Construction: Flat; Length: 3.2mm; Width: 1.6mm; Height: 0.85mm; Thickness: 0.037inch; Depth: 1.6mm; Radiation Hardening: No; RoHS Compliant: Yes; ComponentLink1URL: https://datasheet.ciiva.com/11465/upy-np0x7r-mv-100-to-630v-9-11465413.pdf?src-supplier=Avnet; ComponentLink1Description: https://datasheet.ciiva.com/11465/upy-np0x7r-mv-100-to-630v-9-11465413.pdf?src-supplier=Avnet; ComponentLink2URL: https://datasheet.ciiva.com/13210/upy-gp-np0-16v-to-50v-8-13210277.pdf?src-supplier=Mouser; ComponentLink2Description: https://datasheet.ciiva.com/13210/upy-gp-np0-16v-to-50v-8-13210277.pdf?src-supplier=Mouser; Supplier Part Number 1: CC1206JRX7R0BB473; LCSC Part Number: C577197
D6 = SMBJ70A/TR13: 1uA 5.3A 113V 77.8V 70V 86V Unidirectional SMB(DO-214AA) TVS ROHS; Manufacturer: Brightking; Manufacturer Part Number: SMBJ70A/TR13; Footprint: SMB(DO-214AA); ComponentLink1Description: LCSC; ComponentLink1URL: https://www.lcsc.com/product-detail/TVS_Brightking-SMBJ70A-TR13_C309982.html
D7 = SS510B: SCHOTTKY DIODE SMB 100V 5A; Manufacturer: MDD; Manufacturer Part Number: SS510B; Footprint: SMB; ComponentLink1Description: LCSC; ComponentLink1URL: https://lcsc.com/product-detail/Schottky-Barrier-Diodes-SBD_WEIDA-SS510B_C2915231.html
J2 = TBP01R1-508-02BE: TERMINAL BLOCK, PLUGGABLE, 5.08,; Manufacturer: CUI Devices; Supplier 1: Arrow Electronics; Manufacturer Part Number: TBP01R1-508-02BE; RoHS: Yes; Category: Terminal Blocks; Stock 1: 1821; Pricing 1: 1=0.57450, 10=0.23530, 25=0.18730, 50=0.17170, 100=0.16040, 400=0.14010, 800=0.12060, 1200=0.11290 (USD); Supplier Part Number 1: TBP01R1-508-02BE
Q20 = RU6085H: 60V 80A 2.5W 7mΩ@10V,20A 3V@250μA N Channel SOP-8_150mil MOSFETs ROHS; Manufacturer: Shenzhen; Manufacturer Part Number: RU6085H; Footprint: SOP-8_150mil; ComponentLink1Description: LCSC; ComponentLink1URL: https://lcsc.com/product-detail/MOSFETs_Shenzhen-ruichips-Semicon-RU6085H_C181990.html
R64 = RC0805FR-07100KL: RES 100K OHM 1% 1/8W 0805; Manufacturer: Yageo; Resistance: 100kR; Power Rating: 125mW; Voltage Rating (DC): 150V; Temperature Coefficient: 100ppm/°C; Item Type: Resistor; Supplier 1: Avnet; Manufacturer Part Number: RC0805FR-07100KL; RoHS: Yes; Category: Chip SMD Resistors; Stock 1: 695000; Pricing 1: 5000=0.00227, 10000=0.00224, 20000=0.00217 (USD); Case/Package: 0805; Number of Pins: 2; Case Code (Metric): 2012; Case Code (Imperial): 0805; Size Code: 0805; Min Operating Temperature: -55°C; Max Operating Temperature: 155°C; Resistor Type: Thick Film; Tolerance: 1%; Packaging: Tape and Reel; Voltage Rating: 150V; Package Quantity: 1; Number of Terminations: 2; Termination: SMD/SMT; Max Power Dissipation: 125mW; Features: Moisture Resistant; Series: RC; Construction: Rectangular; Resistance Tolerance: 1%; Technology: THICK FILM; Length: 0.079inch; Width: 0.049inch; Height: 0.024inch; Depth: 1.25mm; Lead Pitch: 0.4mm; Lead Free: Lead Free; RoHS Compliant: Yes; Military Standard: Not; ComponentLink1URL: https://datasheet.ciiva.com/11808/0900766b8106beab-11808858.pdf?src-supplier=RSComponents; ComponentLink1Description: https://datasheet.ciiva.com/11808/0900766b8106beab-11808858.pdf?src-supplier=RSComponents; ComponentLink2URL: https://datasheet.ciiva.com/7941/1686128-7941677.pdf?src-supplier=Element14; ComponentLink2Description: https://datasheet.ciiva.com/7941/1686128-7941677.pdf?src-supplier=Element14; ComponentLink3URL: https://datasheet.ciiva.com/7660/38627-7660796.pdf?src-supplier=Element14; ComponentLink3Description: https://datasheet.ciiva.com/7660/38627-7660796.pdf?src-supplier=Element14; ComponentLink4URL: https://datasheet.ciiva.com/22747/444164-22747534.pdf?src-supplier=Element14; ComponentLink4Description: https://datasheet.ciiva.com/22747/444164-22747534.pdf?src-supplier=Element14; ComponentLink5URL: https://datasheet.ciiva.com/2457/pyu-r-int-thick-7-2457018.pdf?src-supplier=Digi-Key; ComponentLink5Description: https://datasheet.ciiva.com/2457/pyu-r-int-thick-7-2457018.pdf?src-supplier=Digi-Key; ComponentLink6URL: https://datasheet.ciiva.com/2457/pyu-r-int-thick-7-2457019.pdf?src-supplier=Digi-Key; ComponentLink6Description: https://datasheet.ciiva.com/2457/pyu-r-int-thick-7-2457019.pdf?src-supplier=Digi-Key; ComponentLink7URL: https://datasheet.ciiva.com/2457/pyu-r-int-thick-7-2457017.pdf?src-supplier=Digi-Key; ComponentLink7Description: https://datasheet.ciiva.com/2457/pyu-r-int-thick-7-2457017.pdf?src-supplier=Digi-Key; ComponentLink8URL: https://datasheet.ciiva.com/12667/rc0805-12667001.pdf?src-supplier=Mouser; ComponentLink8Description: https://datasheet.ciiva.com/12667/rc0805-12667001.pdf?src-supplier=Mouser; ComponentLink9URL: https://datasheet.ciiva.com/7941/1697719-7941676.pdf?src-supplier=Element14; ComponentLink9Description: https://datasheet.ciiva.com/7941/1697719-7941676.pdf?src-supplier=Element14; ComponentLink10URL: https://datasheet.ciiva.com/7941/1697719-7941678.pdf?src-supplier=Element14; ComponentLink10Description: https://datasheet.ciiva.com/7941/1697719-7941678.pdf?src-supplier=Element14; ComponentLink11URL: https://datasheet.ciiva.com/16747/rc0805-16747226.pdf?src-supplier=Future+Electronics; ComponentLink11Description: https://datasheet.ciiva.com/16747/rc0805-16747226.pdf?src-supplier=Future+Electronics; Supplier Part Number 1: RC0805FR-07100KL; LCSC Part Number: C96346
R65 = RC1206FR-7W1KL: RES 1K OHM 1% 1/2W 1206; Manufacturer: Yageo; Item Type: Resistor; Supplier 1: Digi-Key; Manufacturer Part Number: RC1206FR-7W1KL; RoHS: Yes; Category: Chip SMD Resistors; Stock 1: 6215; Pricing 1: 1=0.19000, 10=0.15700, 100=0.06150, 1000=0.02572, 2500=0.02358 (USD); RoHS Compliant: Yes; Supplier Part Number 1: 13-RC1206FR-7W1KLCT-ND; LCSC Part Number: C859155; ComponentLink1Description: LCSC; ComponentLink1URL: https://www.lcsc.com/product-detail/Chip-Resistor-Surface-Mount_YAGEO-RC1206FR-7W1KL_C859155.html
R149 = 25121WJ0000T4E: 1W Thick Film Resistors ±5% ±800ppm/℃ 0Ω 2512 Chip Resistor - Surface Mount ROHS; Manufacturer: UNI-ROYAL; Manufacturer Part Number: 25121WJ0000T4E; Package: 2512; LCSC Part Number: C25469; Item Type: Resistor; ComponentLink1Description: LCSC; ComponentLink1URL: https://www.lcsc.com/product-detail/Chip-Resistor-Surface-Mount_UNI-ROYAL-Uniroyal-Elec-25121WJ0000T4E_C25469.html
SB7 SB40 = Solder Bridge: Solder Bridge ON
U7 = LTC4359CMS8#PBF: IC OR CTRLR N+1 8MSOP; Manufacturer: Analog Devices / Linear Technology; Max Supply Voltage: 80V; Max Output Current: 180mA; Min Supply Voltage: 4V; Turn-On Delay Time: 200us; Turn-Off Delay Time: 300ns; Operating Supply Current: 150uA; Number of Drivers: 1; Supplier 1: Mouser; Manufacturer Part Number: LTC4359CMS8#PBF; RoHS: Yes; Category: Power Management ICs; Stock 1: 57; Pricing 1: 1=4.95000, 10=4.44000, 50=4.19000, 100=3.63000, 1000=3.09000, 10000=3.09000 (USD); Case/Package: MSOP; Number of Pins: 8; Min Operating Temperature: 0°C; Max Operating Temperature: 70°C; Package Quantity: 50; Packaging: Rail/Tube; Lead Free: Lead Free; ComponentLink1URL: https://datasheet.ciiva.com/6609/4359fb-6609306.pdf?src-supplier=Digi-Key; ComponentLink1Description: https://datasheet.ciiva.com/6609/4359fb-6609306.pdf?src-supplier=Digi-Key; Supplier Part Number 1: 584-LTC4359CMS8#PBF